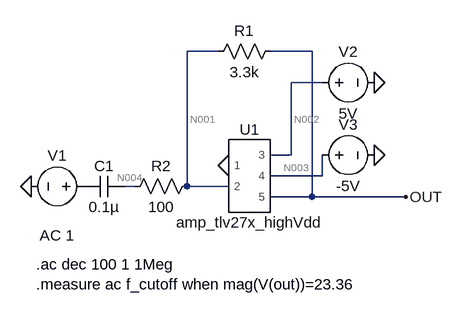
[diagram p0: schematic Exercise-8-3b_active-high-pass-filter.asc]
Exercise-8-3b_active-high-pass-filter.asc, the LTspice schematic file:
Version 4.1
SHEET 1 880 680
WIRE 384 -48 336 -48
WIRE 528 -48 464 -48
WIRE 544 0 496 0
WIRE 496 112 496 0
WIRE 496 112 464 112
WIRE 544 144 544 112
WIRE 544 144 464 144
WIRE 256 160 240 160
WIRE 336 160 336 -48
WIRE 400 160 336 160
WIRE 528 176 528 -48
WIRE 528 176 464 176
WIRE 672 176 528 176
FLAG 96 160 0
FLAG 624 112 0
FLAG 624 0 0
FLAG 672 176 OUT
FLAG 400 128 0
SYMBOL EEL3111C\\amp_tlv27x_highVdd 432 144 R0
SYMATTR InstName U1
SYMBOL cap 240 144 R90
WINDOW 0 0 32 VBottom 2
WINDOW 3 32 32 VTop 2
SYMATTR InstName C1
SYMATTR Value 0.1µ
SYMBOL voltage 192 160 R90
WINDOW 0 -32 56 VBottom 2
WINDOW 3 32 56 VTop 2
WINDOW 123 60 56 VTop 2
WINDOW 39 0 0 Left 0
SYMATTR InstName V1
SYMATTR Value ""
SYMATTR Value2 AC 1
SYMBOL voltage 528 0 R270
WINDOW 0 32 56 VTop 2
WINDOW 3 -32 56 VBottom 2
WINDOW 123 0 0 Left 0
WINDOW 39 0 0 Left 0
SYMATTR InstName V2
SYMATTR Value 5V
SYMBOL voltage 528 112 R270
WINDOW 0 32 56 VTop 2
WINDOW 3 -32 56 VBottom 2
WINDOW 123 0 0 Left 0
WINDOW 39 0 0 Left 0
SYMATTR InstName V3
SYMATTR Value -5V
SYMBOL res 480 -64 R90
WINDOW 0 0 56 VBottom 2
WINDOW 3 32 56 VTop 2
SYMATTR InstName R1
SYMATTR Value 3.3k
SYMBOL res 352 144 R90
WINDOW 0 0 56 VBottom 2
WINDOW 3 32 56 VTop 2
SYMATTR InstName R2
SYMATTR Value 100
TEXT 104 280 Left 2 !.ac dec 100 1 1Meg\n.measure ac f_cutoff when mag(V(out))=23.36

The netlist it stands for:
* Exercise-8-3b_active-high-pass-filter.asc
X§U1 0 N001 N002 N003 OUT amp_tlv27x_highVdd  ; pins 1 2 3 4 5
C1 N004 P001 0.1µ
V1 P001 0 AC 1
V2 N002 0 5V
V3 N003 0 -5V
R1 OUT N001 3.3k
R2 N001 N004 100
.ac dec 100 1 1Meg
.measure ac f_cutoff when mag(V(out))=23.36
.lib TLV271.LIB
.backanno
.end

* Results of the author's LTspice run, read from the files saved beside the schematic
* Operating Point, zero values left out:
*   V(n001) = -280.4 µV
*   V(n002) = 5 V
*   V(n003) = -5 V
*   V(n004) = -280.4 µV
*   V(out) = -280.5 µV
*   I(R1) = -6.901 pA
*   I(V2) = -67.78 µA
*   I(V3) = 67.78 µA
*   Ix(u1:1) = -6.9 pA
*   Ix(u1:2) = -6.901 pA
*   Ix(u1:3) = 67.78 µA
*   Ix(u1:4) = -67.78 µA
*   Ix(u1:5) = 7.131 pA
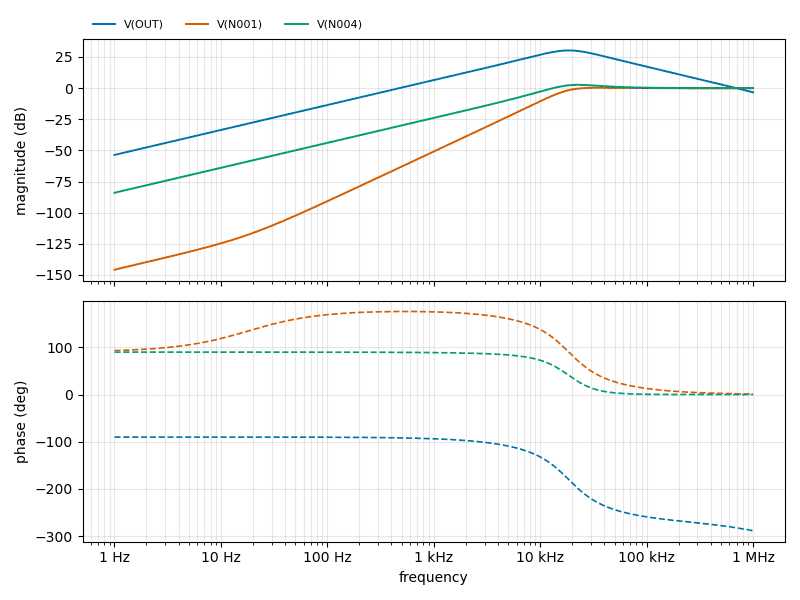
[diagram p1: AC Analysis of Exercise-8-3b_active-high-pass-filter.asc, plotted from the saved traces]
* AC Analysis, 1 run:
*   V(OUT): -53.67 dB at 1 Hz, -3.41 dB at 1 MHz, peak 30.23 dB at 18.62 kHz, 3 dB below the peak at 10.58 kHz and 32.64 kHz
*   V(N001): -145.76 dB at 1 Hz, -0.20 dB at 1 MHz, peak 0.20 dB at 33.88 kHz, 3 dB below the peak at 16.62 kHz
*   V(N004): -84.03 dB at 1 Hz, 0.00 dB at 1 MHz, peak 2.59 dB at 22.91 kHz, 3 dB below the peak at 12.7 kHz
* From the log:
*   f_cutoff: mag(V(out))=23.36 AT 32052.6187188